# EasyEDA Pro project ref_dreamcast_v3.epro

# Schematic Schematic1
Board Name: Board1; Create Date: 2026-11-04; Page Name: P1; Project Name: RUSH - Dreamcast; Schematic Name: Schematic1; Update Date: 2026-11-15; Company: EasyEDA.com; Drawn: Erick; Page Size: A4; Version: V1.0
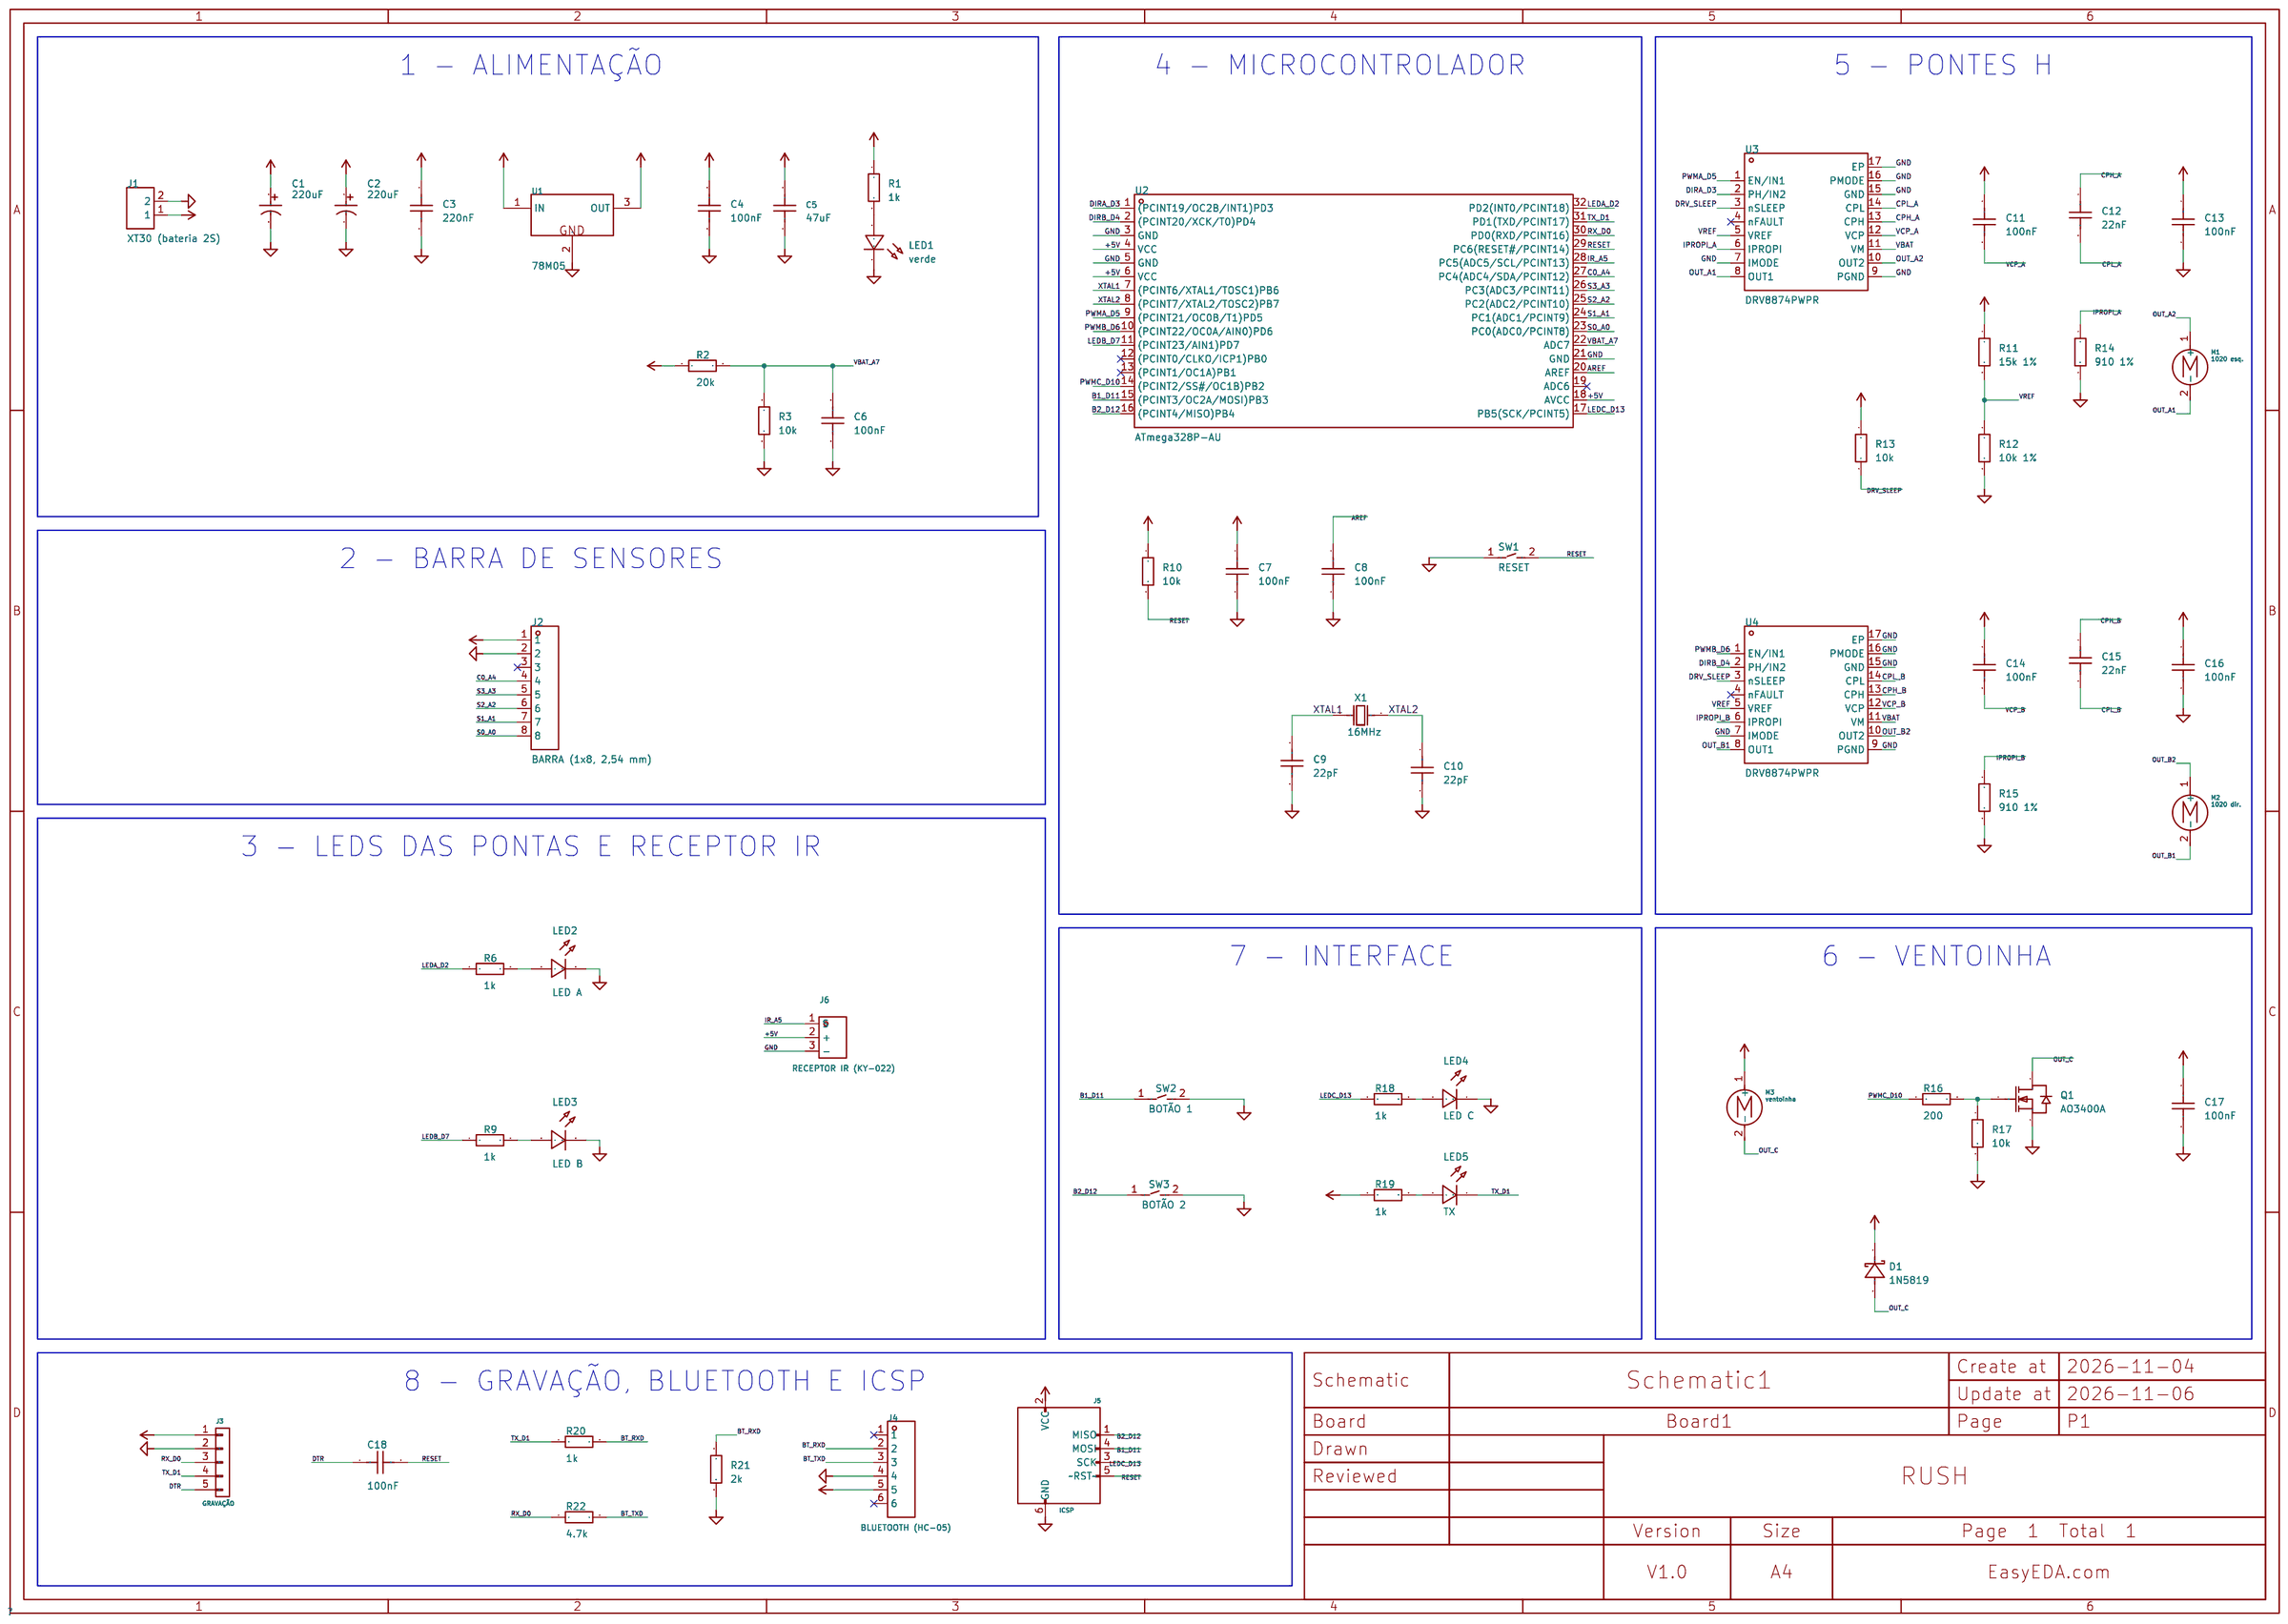
[diagram p0: schematic sheet]

## Parts
C1  220uF  [CAP-SMD_BD6.3-L6.6-W6.6-FD]
C2  220uF  [CAP-SMD_BD6.3-L6.6-W6.6-FD]
C3  220nF  [C0603]
C4  100nF  [C0603]
C5  47uF  [C1210]
C6  100nF  [C0603]
C7  100nF  [C0603]
C8  100nF  [C0603]
C9  22pF  [C0603]
C10  22pF  [C0603]
C11  100nF  [C0603]
C12  22nF  [C0603]
C13  100nF  [C0603]
C14  100nF  [C0603]
C15  22nF  [C0603]
C16  100nF  [C0603]
C17  100nF  [C0603]
C18  100nF  [C0603]
D1  1N5819  [SOD-123_L2.7-W1.6-LS3.7-RD-1]
J1  XT30 (bateria 2S)  [CONN-TH_XT30U-M]
J2  BARRA (1x8, 2,54 mm)  [HDR-TH_8P-P2.54-V-M]
J3  GRAVAÇÃO  [seguidor_alpha:HDR_1x05_P2.54_SMD_DEITADA]
J4  BLUETOOTH (femea 1x6, ordem HC-05)  [HDR-TH_6P-P2.54-V-F]
J5  ICSP  [seguidor_alpha:ICSP_6P_SMD_BOT]
J6  KY-022 (femea 1x3, S + -)  [HDR-TH_3P-P2.54-V-F_KY022]
LED1  verde  [LED0603-RD_GREEN]
LED2  LED A  [LED0603-RD_GREEN]
LED3  LED B  [LED0603-RD_GREEN]
LED4  LED C  [LED0603-RD_GREEN]
LED5  TX  [LED0603-RD_GREEN]
M1  1020 esq.  [seguidor_alpha:MOTOR_1020_2P]
M2  1020 dir.  [seguidor_alpha:MOTOR_1020_2P]
M3  ventoinha  [seguidor_alpha:MOTOR_1020_2P]
Q1  AO3400A  [SOT-23-3_L2.9-W1.3-P1.90-LS2.4-BR]
R1  1k  [R0603]
R2  20k 1%  [R0603]
R3  10k 1%  [R0603]
R6  1k  [R0603]
R9  1k  [R0603]
R10  10k  [R0603]
R11  15k 1%  [R0603]
R12  10k 1%  [R0603]
R13  10k  [R0603]
R14  910 1%  [R0603]
R15  910 1%  [R0603]
R16  200  [R0603]
R17  10k  [R0603]
R18  1k  [R0603]
R19  1k  [R0603]
R20  1k  [R0603]
R21  2k  [R0603]
R22  4.7k  [R0603]
SW1  RESET  [KEY-SMD_L6.1-W3.7-LS8.0-2]
SW2  BOTÃO 1  [KEY-SMD_L6.1-W3.7-LS8.0-2]
SW3  BOTÃO 2  [KEY-SMD_L6.1-W3.7-LS8.0-2]
U1  78M05  [TO-252-2_L6.5-W6.1-P4.58-LS10.0-TL]
U2  ATmega328P-AU  [TQFP-32_L7.0-W7.0-P0.80-LS9.0-BL]
U3  DRV8874PWPR  [HTSSOP-16_L5.0-W4.4-P0.65-LS6.4-BL-EP]
U4  DRV8874PWPR  [HTSSOP-16_L5.0-W4.4-P0.65-LS6.4-BL-EP]
X1  16MHz  [CRYSTAL-SMD_L5.0-W3.2]

## Library data of the parts
C1 C2 = CS1C221M-CRE77_C96175: Capacitance:220uF Tolerance:±20% Tolerance:±20% Voltage Rating:16V Ripple Current:- Equivalent Series Resistance(ESR):- Diameter:6.3mm Height - Seated (Max):7.7mm Lifetime:2000hrs@105℃ Operating Temperature:-40℃~+105℃ Operating Temperature:-40℃~+105℃ Pola; LCSC Part Name: 220uF ±20% 16V; Supplier Part: C96175; Manufacturer: ST(先科); Manufacturer Part: CS1C221M-CRE77; Supplier Footprint: SMD,D6.3xL7.7mm; JLCPCB Part Class: Extended Part; Datasheet: https://item.szlcsc.com/datasheet/CS1C221M-CRE77/97379.html; Supplier: LCSC; Tolerance: ±20%; Voltage Rating: 16V; Diameter: 6.3mm; Height - Seated (Max): 7.7mm; Lifetime: 2000hrs@105℃; Operating Temperature: -40℃~+105℃; Polarity type: Polarized
C3 = CAP_0603: Supplier Footprint: 0603; Encapsulamento: 0603 50 V; DNP: no; Voltage Rating: 50V
C4 C9 C10 = CAP_0603: Supplier Footprint: 0603; Encapsulamento: 0603; DNP: no; Voltage Rating: 16V
C5 = GRM32ER61A476KE20L: Capacitance:47uF Tolerance:±10% Tolerance:±10% Voltage Rating:10V Temperature Coefficient:X5R; LCSC Part Name: 47uF ±10% 10V; Supplier Part: C397312; Manufacturer: muRata(村田); Supplier Footprint: 1210; JLCPCB Part Class: Extended Part; Datasheet: https://item.szlcsc.com/datasheet/GRM32ER61A476KE20L/378872.html; Supplier: LCSC; Tolerance: ±10%; Voltage Rating: 10V; Temperature Coefficient: X5R
C6 = CAP_0603: filtro da medicao (opcional); Supplier Footprint: 0603; Encapsulamento: 0603; DNP: no; Voltage Rating: 16V
C7 = CAP_0603: junto aos pinos VCC; Supplier Footprint: 0603; Encapsulamento: 0603; DNP: no; Voltage Rating: 16V
C8 = CAP_0603: AREF (referencia = AVCC no firmware); Supplier Footprint: 0603; Encapsulamento: 0603; DNP: no; Voltage Rating: 16V
C11 C14 = CAP_0603: VCP -> VM; Supplier Footprint: 0603; Encapsulamento: 0603 16 V X7R; DNP: no; Voltage Rating: 16V
C12 C15 = CAP_0603: CPH -> CPL (tensao >= VM); Supplier Footprint: 0603; Encapsulamento: 0603 50 V X7R; DNP: no; Voltage Rating: 50V
C13 C16 = CAP_0603: VM, junto ao pino 11; Supplier Footprint: 0603; Encapsulamento: 0603 25 V X7R; DNP: no; Voltage Rating: 25V
C17 = CAP_0603: Supplier Footprint: 0603; Encapsulamento: 0603 25 V; DNP: no; Voltage Rating: 25V
C18 = CAP_0603: reset automatico pelo DTR; Supplier Footprint: 0603; Encapsulamento: 0603; DNP: no; Voltage Rating: 16V
D1 = 1N5819HW: diodo de roda livre (novo; o EVA-RT nao tem); LCSC Part Name: 电压:40V 电流:1A; Supplier Part: C2905649; Manufacturer: TECH PUBLIC(台舟); Supplier Footprint: SOD-123; JLCPCB Part Class: Extended Part; Datasheet: https://item.szlcsc.com/datasheet/1N5819HW/3175946.html; Supplier: LCSC; Voltage - Forward(Vf@If): 900mV@3A; Voltage - DC Reverse(Vr): 40V; Current - Rectified: 1A; Reverse Leakage Current (Ir): 1mA@40V; Non-Repetitive Peak Forward Surge Current: 9A; Encapsulamento: SOD-123 (B5819W) ou 1N5819 nos terminais do motor; DNP: no
J1 = XT30U-M.G.B: pino 1 = +, pino 2 = -; LCSC Part Name: AMASS(艾迈斯)模插头锂电池插头电机控制器充电器电池接头连接器焊接 2芯锂电插头 黑色 公头15AXT30U-M.G.B; Supplier Part: C19268020; Manufacturer: AMASS(艾迈斯); JLCPCB Part Class: Extended Part; Datasheet: https://item.szlcsc.com/datasheet/XT30U-M.G.B/20526031.html; Supplier: LCSC; Encapsulamento: XT30PW-M de placa ou rabicho XT30; DNP: no
J2 = 2.54-1*8: Pin Structure:1x8P Pitch:2.54mm Circluar Pins/Square Pins:Pin Header Mounting Type:Through Hole Number of Rows:1 Number of Pins:8P Current Rating:2.5A Length of Mating Pin:6mm Insulation Height:2.54mm Length of End Connection Pin:3mm Contact Material:Bras; LCSC Part Name: 1x8P 间距:2.54mm 方针 直插; Supplier Part: C5156616; Manufacturer: ZHOURI(洲日); Supplier Footprint: 插件,P=2.54mm; JLCPCB Part Class: Extended Part; Datasheet: https://item.szlcsc.com/datasheet/2.54-1*8/5790716.html; Supplier: LCSC; Pin Structure: 1x8P; Pitch: 2.54mm; Circluar Pins/Square Pins: Pin Header; Mounting Type: Through Hole; Number of Rows: 1; Number of Pins: 8P; Current Rating: 2.5A; Length of Mating Pin: 6mm; Insulation Height: 2.54mm; Length of End Connection Pin: 3mm; Contact Material: Brass; Contact Plating: Gold; Operating Temperature: -40℃~+105℃; Encapsulamento: barra de pinos 1x8 2,54 mm; DNP: no
J3 = Connector_Generic_Conn_01x05: 1=+5V, 2=GND, 3=RX_D0, 4=TX_D1, 5=DTR. Face inferior no layout.; Encapsulamento: 5 pads SMD, passo 2,54 mm; montagem na face inferior; DNP: no
J4 = 2.54-1*6P母: frente direita, x = 32,5; HC-06 nas vias 2-5 (virado); LCSC Part Name: 1x6P 间距:2.54mm 直插; Supplier Part: C40877; Manufacturer: BOOMELE(博穆精密); Supplier Footprint: 插件,P=2.54mm; JLCPCB Part Class: Extended Part; Datasheet: https://item.szlcsc.com/datasheet/2.54-1*6P%25E6%25AF%258D/41861.html; Supplier: LCSC; Holes Structure: 1x6P; Pitch: 2.54mm; Circular Hole / Square Hole: Square Hole; Mounting Type: Through Hole; Number of Rows: 1; Number of Positions: 6P; Current Rating: 3A; Holes Direction: Top; Insulation Height: 8.5mm; Contact Material: Brass; Contact Plating: Gold; Operating Temperature: -40℃~+105℃; PIN Length: 3.2mm; Encapsulamento: barra femea 1x6 2,54 mm; DNP: no
J5 = Connector_AVR-ISP-6: posicoes do EVA-RT: x 33,97/36,51; y -8,36/-10,90/-13,44; Encapsulamento: 6 pads SMD D1,8 em grade 2,54; DNP: no
J6 = Header-Female-2.54_1x3 (KY-022): barra femea 1x3; 1 = S (A5), 2 = +5V, 3 = GND; Holes Structure: 1x3P; Pitch: 2.54mm; Mounting Type: Through Hole; Number of Positions: 3P; Encapsulamento: barra femea 1x3 2,54 mm; DNP: no
LED1 = LED_0603-G: indica 5 V presente; Encapsulamento: 0603; DNP: no
LED2 LED3 LED5 = LED_0603-G: Encapsulamento: 0603; DNP: no
LED4 = LED_0603-G: vermelho; o LED3 em paralelo do EVA-RT foi retirado; Encapsulamento: 0603; DNP: no
M1 M2 = Motor_Motor_DC: coreless 1020 7,4 V; se girar ao contrario, inverta os fios; Encapsulamento: 2 pads; DNP: no
M3 = Motor_Motor_DC: coreless 1020 7,4 V; Encapsulamento: 2 pads; DNP: no
Q1 = AO3400A_C20917: no lugar do IRFR3411/RM10N100LD; liga totalmente com 5 V no gate; LCSC Part Name: N沟道 耐压:30V; Supplier Part: C20917; Manufacturer: AOS; Supplier Footprint: SOT-23; JLCPCB Part Class: Basic Part; Datasheet: https://item.szlcsc.com/datasheet/AO3400A/21629.html; Supplier: LCSC; Number: 1 N-channel; Drain to Source Voltage: 30V; Current - Continuous Drain(Id): 5.7A; RDS(on): 48mΩ@2.5V; Pd - Power Dissipation: 1.4W; Gate Threshold Voltage (Vgs(th)): 1.45V; Gate Charge(Qg): 7nC@10V; Input Capacitance(Ciss): 630pF; Reverse Transfer Capacitance (Crss@Vds): 50pF; Operating Temperature: -55℃~+150℃; Type: N-Channel; Output Capacitance(Coss): 75pF; Vgs: ±12V; Encapsulamento: SOT-23 (1 = G, 2 = S, 3 = D); DNP: no
R1 R6 R9 R18 R19 = Res_0603: Supplier Footprint: 0603; Encapsulamento: 0603; DNP: no
R2 R3 = Res_0603: medicao da bateria (opcional); Supplier Footprint: 0603; Encapsulamento: 0603; DNP: no
R10 = Res_0603: EVA-RT usava 1k; 10k com reset automatico por DTR; Supplier Footprint: 0603; Encapsulamento: 0603; DNP: no
R11 R12 = Res_0603: VREF = 2,0 V; Supplier Footprint: 0603; Encapsulamento: 0603; DNP: no
R13 = Res_0603: nSLEEP sempre alto (pull-down interno de 100k); Supplier Footprint: 0603; Encapsulamento: 0603; DNP: no
R14 R15 = Res_0603: IPROPI -> limite de corrente; Supplier Footprint: 0603; Encapsulamento: 0603; DNP: no
R16 = Res_0603: gate; Supplier Footprint: 0603; Encapsulamento: 0603; DNP: no
R17 = Res_0603: gate -> GND (desligado no boot); Supplier Footprint: 0603; Encapsulamento: 0603; DNP: no
R20 R21 = Res_0603: divisor 5 V -> 3,3 V; Supplier Footprint: 0603; Encapsulamento: 0603; DNP: no
R22 = Res_0603: 4,7k: grava com o HC-05 encaixado (sem LED de RX); Supplier Footprint: 0603; Encapsulamento: 0603; DNP: no
SW1-SW3 = TVBM17-025CF-R: Circuit:SPST Actuator Style:Rectangular Button Mounting Type:Surface Mount,Vertical Length:6.1mm Width:3.7mm Switch Height:2.5mm with Bracket:Without Bracket Contact Current:50mA Voltage Rating:12V With Lamp:No Termination Style:Gull Wing Operating Temper; LCSC Part Name: 一型/贴片/2.5H/250gf/黑底PPA白钮/防尘/编带; Supplier Part: C19271064; Manufacturer: jianfu(键富); Supplier Footprint: SMD,6.1x3.7mm; JLCPCB Part Class: Extended Part; Datasheet: https://item.szlcsc.com/datasheet/TVBM17-025CF-R/20539419.html; Supplier: LCSC; Circuit: SPST; Actuator Style: Rectangular Button; Mounting Type: Surface Mount,Vertical; Length: 6.1mm; Width: 3.7mm; Switch Height: 2.5mm; with Bracket: Without Bracket; Contact Current: 50mA; Voltage Rating: 12V; With Lamp: No; Termination Style: Gull Wing; Operating Temperature: -40℃~+85℃
U1 = 78M05_C111265: Output Configuration:Positive Voltage - Supply:35V Output Voltage:5V Output Voltage:5V Output Current:500mA Power Supply Rejection Ratio (PSRR):78dB@(120Hz) Voltage Dropout:2V@(500mA) standby current:6mA Noise:- Features:- Operating Temperature:-40℃~+125℃; LCSC Part Name: 5V 500mA 35V; Supplier Part: C111265; Manufacturer: SHIKUES(时科); Supplier Footprint: TO-252-2(DPAK); JLCPCB Part Class: Extended Part; Datasheet: https://item.szlcsc.com/datasheet/78M05/112491.html; Supplier: LCSC; Output Configuration: Positive; Voltage - Supply: 35V; Output Voltage: 5V; Output Current: 500mA; Power Supply Rejection Ratio (PSRR): 78dB@(120Hz); Voltage Dropout: 2V@(500mA); standby current: 6mA; Operating Temperature: -40℃~+125℃; Output Type: Fixed; Number of Outputs: 1; Encapsulamento: TO-252 (DPAK); DNP: no
U2 = ATMEGA328P-AU_C14877: do Nano/Uno doador (com bootloader) ou novo + bootloader pelo ICSP; LCSC Part Name: 基于AVR增强型RISC架构的低功耗CMOS 8位微控制器; Supplier Part: C14877; Manufacturer: MICROCHIP(美国微芯); Manufacturer Part: ATMEGA328P-AU; Supplier Footprint: TQFP-32(7x7); JLCPCB Part Class: Extended Part; Datasheet: https://item.szlcsc.com/datasheet/ATMEGA328P-AU/15549.html; Supplier: LCSC; CPU Core: AVR; CPU Maximum Speed: 20MHz; Core Size: 8 Bit; Program Storage Size: 32KB; Program Memory Type: FLASH; RAM Size: 2KB; EEPROM: 1KB; Number of I/O: 23; ADC (Bit): 10bit; Oscillator Type: Built-in; Voltage - Supply: 1.8V~5.5V; Operating Temperature: -40℃~+85℃; Features: External pin reset (NRST)；Built-in general-purpose timer；Power-on reset (POR)；Touch function；Undervoltage detection (BOR/LVD/LVR/LVI)；Programmable watchdog; Encapsulamento: TQFP-32; DNP: no
U3 = DRV8874PWPR: esq.; LCSC Part Name: 6A 有刷直流电机驱动芯片 4.5V~37V; Supplier Part: C1855818; Manufacturer: TI(德州仪器); Supplier Footprint: HTSSOP-16-EP; JLCPCB Part Class: Extended Part; Datasheet: https://www.ti.com/cn/lit/ds/symlink/drv8874.pdf; Supplier: LCSC; Technology: Yes; Number of H-bridges: 1; Peak Current: 6A; RDS(on): 200mΩ; Quiescent Current(Iq): 750nA; Operating Temperature: -40℃~+125℃; Features: Interleaved conduction protection；Current sensing/regulation function; Encapsulamento: HTSSOP-16 (PWP), pad termico com vias; DNP: no
U4 = DRV8874PWPR: dir.; LCSC Part Name: 6A 有刷直流电机驱动芯片 4.5V~37V; Supplier Part: C1855818; Manufacturer: TI(德州仪器); Supplier Footprint: HTSSOP-16-EP; JLCPCB Part Class: Extended Part; Datasheet: https://www.ti.com/cn/lit/ds/symlink/drv8874.pdf; Supplier: LCSC; Technology: Yes; Number of H-bridges: 1; Peak Current: 6A; RDS(on): 200mΩ; Quiescent Current(Iq): 750nA; Operating Temperature: -40℃~+125℃; Features: Interleaved conduction protection；Current sensing/regulation function; Encapsulamento: HTSSOP-16 (PWP), pad termico com vias; DNP: no
X1 = 7A-16.000MAAJ-T: Frequency:16MHz Normal temperature Frequency Tolerance:±30ppm Normal temperature Frequency Tolerance:±30ppm Load Capacitor: Frequency Stability(Full temperature range):±30ppm Frequency Stability(Full temperature range):±30ppm Equivalent Series Resistance; LCSC Part Name: 16MHz ±30ppm 18pF; Supplier Part: C2450102; Manufacturer: TXC(晶技); Supplier Footprint: SMD5032; JLCPCB Part Class: Extended Part; Datasheet: https://atta.szlcsc.com/upload/public/pdf/source/20180326/C97724_C4EFF7A16D0E132C961AD7AA14FCEEAA.pdf; Supplier: LCSC; Normal temperature Frequency Tolerance: ±30ppm; Frequency Stability(Full temperature range): ±30ppm; Equivalent Series Resistance (ESR): 50Ω

## Nets
+5V: C4.1 C5.2 C7.1 J2.1 J3.1(Pin) J4.5 J5.2(VCC) J6.2(+) R1.1 R10.1 R11.1 R13.1 R19.1 U1.3(OUT) U2.4(VCC) U2.6(VCC) U2.18(AVCC)
GND: C1.2 C2.2 C3.2 C4.2 C5.1 C6.2 C7.2 C8.2 C9.2 C10.2 C13.2 C16.2 C17.2 J1.2 J2.2 J3.2(Pin) J4.4 J5.6(GND) J6.3(-) LED1.1(C) LED2.1(C) LED3.1(C) LED4.1(C) Q1.2(S) R3.2 R12.2 R14.2 R15.2 R17.2 R21.2 SW1.1 SW2.2 SW3.2 U1.2(GND) U2.3(GND) U2.5(GND) U2.21(GND) U3.7(IMODE) U3.9(PGND) U3.15(GND) U3.16(PMODE) U3.17(EP) U4.7(IMODE) U4.9(PGND) U4.15(GND) U4.16(PMODE) U4.17(EP)
VBAT: C1.1 C2.1 C3.1 C11.1 C13.1 C14.1 C16.1 C17.1 D1.1(K) J1.1 M3.1(+) R2.1 U1.1(IN) U3.11(VM) U4.11(VM)
VBAT_A7: C6.1 R2.2 R3.1 U2.22(ADC7)
AREF: C8.1 U2.20(AREF)
B1_D11: J5.4(MOSI) SW2.1 U2.15((PCINT3/OC2A/MOSI)PB3)
B2_D12: J5.1(MISO) SW3.1 U2.16((PCINT4/MISO)PB4)
BT_RXD: J4.2 R20.2 R21.1
BT_TXD: J4.3 R22.2
C0_A4: J2.4 U2.27(PC4(ADC4/SDA/PCINT12))
CPH_A: C12.1 U3.13(CPH)
CPH_B: C15.1 U4.13(CPH)
CPL_A: C12.2 U3.14(CPL)
CPL_B: C15.2 U4.14(CPL)
DIRA_D3: U2.1((PCINT19/OC2B/INT1)PD3) U3.2(PH/IN2)
DIRB_D4: U2.2((PCINT20/XCK/T0)PD4) U4.2(PH/IN2)
DRV_SLEEP: R13.2 U3.3(nSLEEP) U4.3(nSLEEP)
DTR: C18.1 J3.5(Pin)
IPROPI_A: R14.1 U3.6(IPROPI)
IPROPI_B: R15.1 U4.6(IPROPI)
IR_A5: J6.1(S) U2.28(PC5(ADC5/SCL/PCINT13))
LEDA_D2: R6.1 U2.32(PD2(INT0/PCINT18))
LEDB_D7: R9.1 U2.11((PCINT23/AIN1)PD7)
LEDC_D13: J5.3(SCK) R18.1 U2.17(PB5(SCK/PCINT5))
OUT_A1: M1.2(-) U3.8(OUT1)
OUT_A2: M1.1(+) U3.10(OUT2)
OUT_B1: M2.2(-) U4.8(OUT1)
OUT_B2: M2.1(+) U4.10(OUT2)
OUT_C: D1.2(A) M3.2(-) Q1.3(D)
PWMA_D5: U2.9((PCINT21/OC0B/T1)PD5) U3.1(EN/IN1)
PWMB_D6: U2.10((PCINT22/OC0A/AIN0)PD6) U4.1(EN/IN1)
PWMC_D10: R16.1 U2.14((PCINT2/SS#/OC1B)PB2)
RESET: C18.2 J5.5(~RST~) R10.2 SW1.2 U2.29(PC6(RESET#/PCINT14))
RX_D0: J3.3(Pin) R22.1 U2.30(PD0(RXD/PCINT16))
S0_A0: J2.8 U2.23(PC0(ADC0/PCINT8))
S1_A1: J2.7 U2.24(PC1(ADC1/PCINT9))
S2_A2: J2.6 U2.25(PC2(ADC2/PCINT10))
S3_A3: J2.5 U2.26(PC3(ADC3/PCINT11))
TX_D1: J3.4(Pin) LED5.1(C) R20.1 U2.31(PD1(TXD/PCINT17))
VCP_A: C11.2 U3.12(VCP)
VCP_B: C14.2 U4.12(VCP)
VREF: R11.2 R12.1 U3.5(VREF) U4.5(VREF)
XTAL1: C9.1 U2.7((PCINT6/XTAL1/TOSC1)PB6) X1.1(OSC1)
XTAL2: C10.1 U2.8((PCINT7/XTAL2/TOSC2)PB7) X1.2(OSC2)
$1N2286: LED1.2(A) R1.2
$1N2289: LED2.2(A) R6.2
$1N2298: LED3.2(A) R9.2
$1N2345: LED4.2(A) R18.2
$1N2346: LED5.2(A) R19.2
$1N2435: Q1.1(G) R16.2 R17.1

Not connected (* = marked no-connect by the designer): J2 3*; J4 1* 6*; U2 12((PCINT0/CLKO/ICP1)PB0)* 13((PCINT1/OC1A)PB1)* 19(ADC6)*; U3 4(nFAULT)*; U4 4(nFAULT)*

## Notes on the sheet
- 1 - ALIMENTAÇÃO
- 4 - MICROCONTROLADOR
- 5 - PONTES H
- 2 - BARRA DE SENSORES
- 3 - LEDS DAS PONTAS E RECEPTOR IR
- 7 - INTERFACE
- 6 - VENTOINHA
- 8 - GRAVAÇÃO, BLUETOOTH E ICSP

# Board PCB1
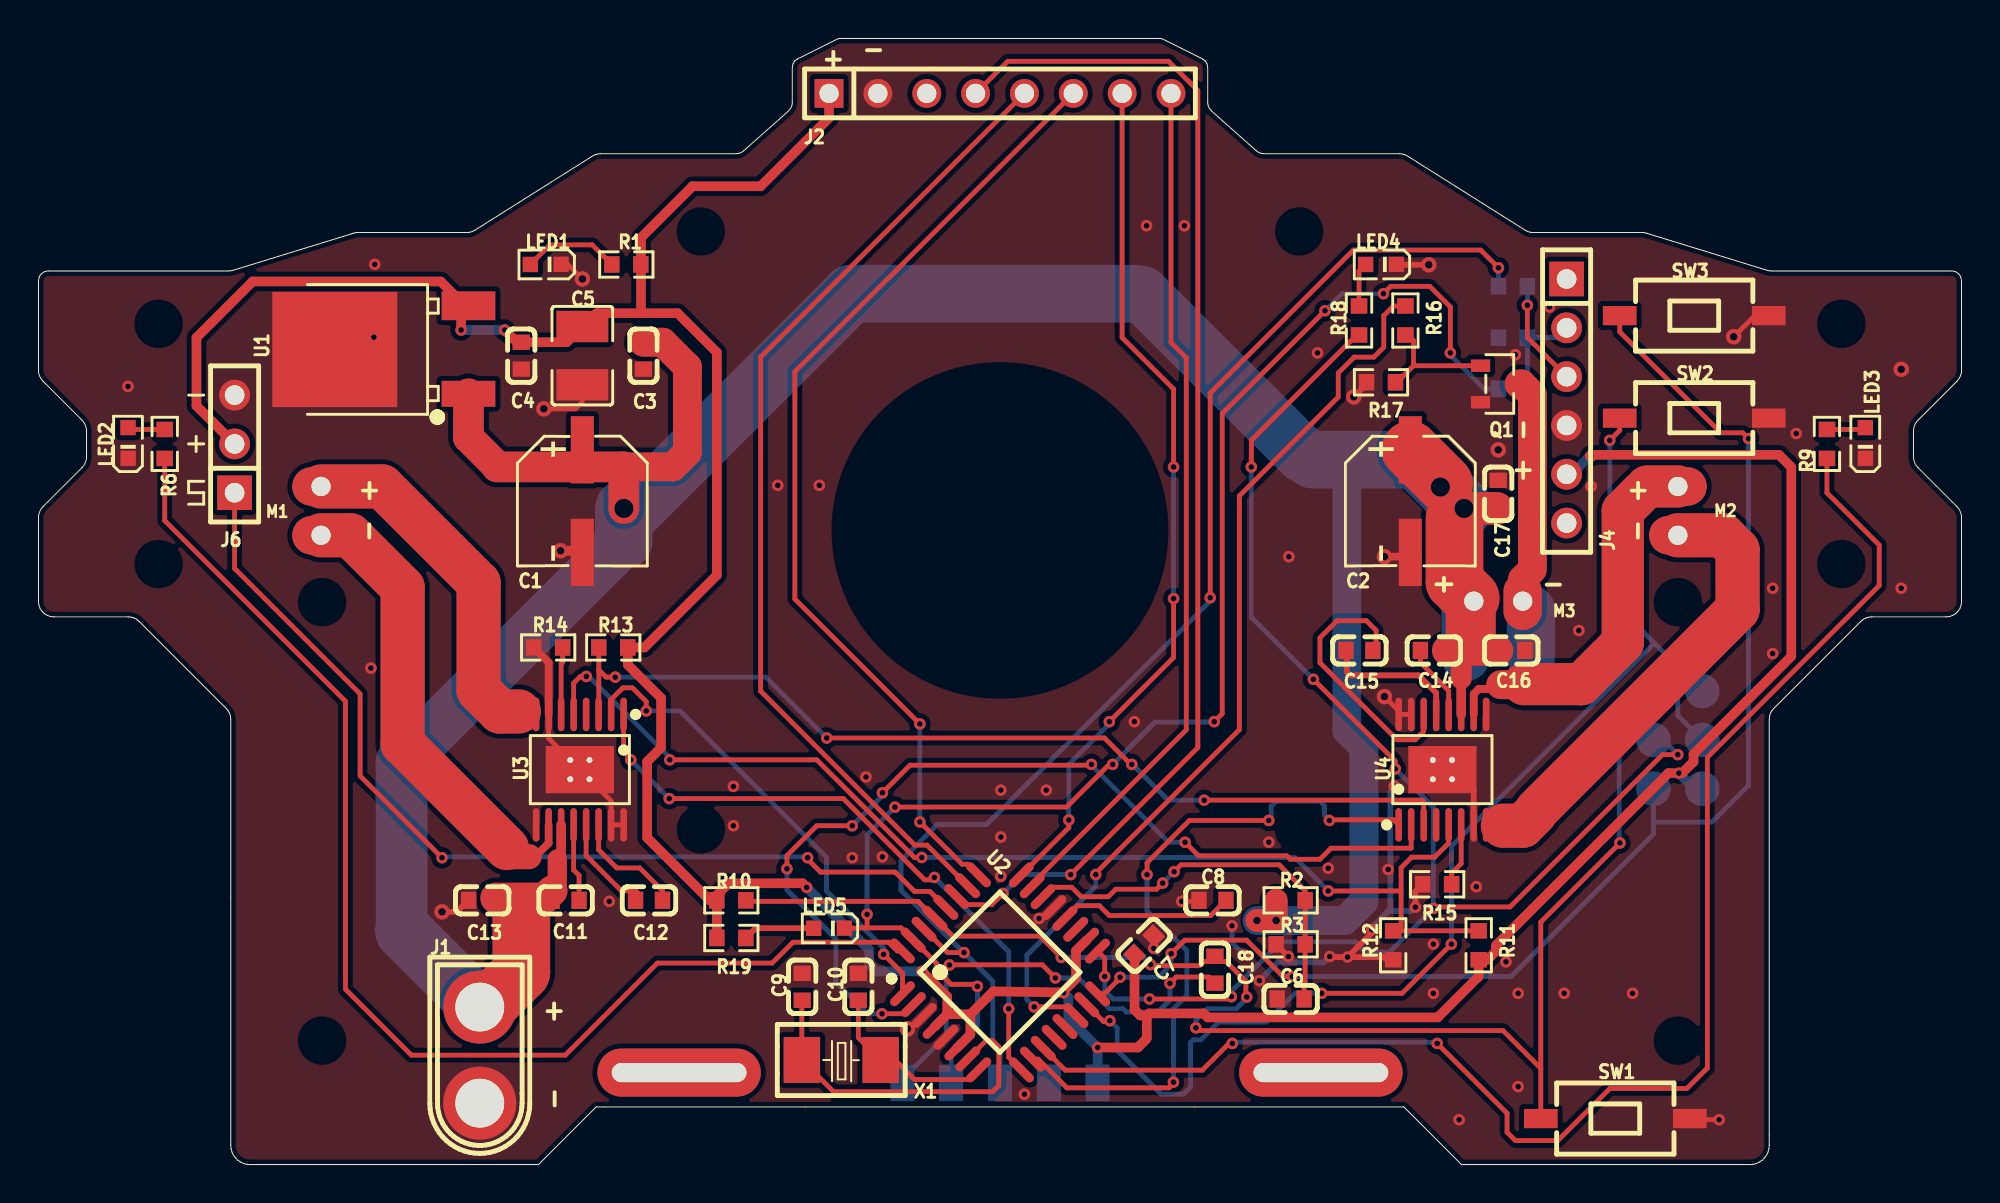
[diagram p1: board, top side]
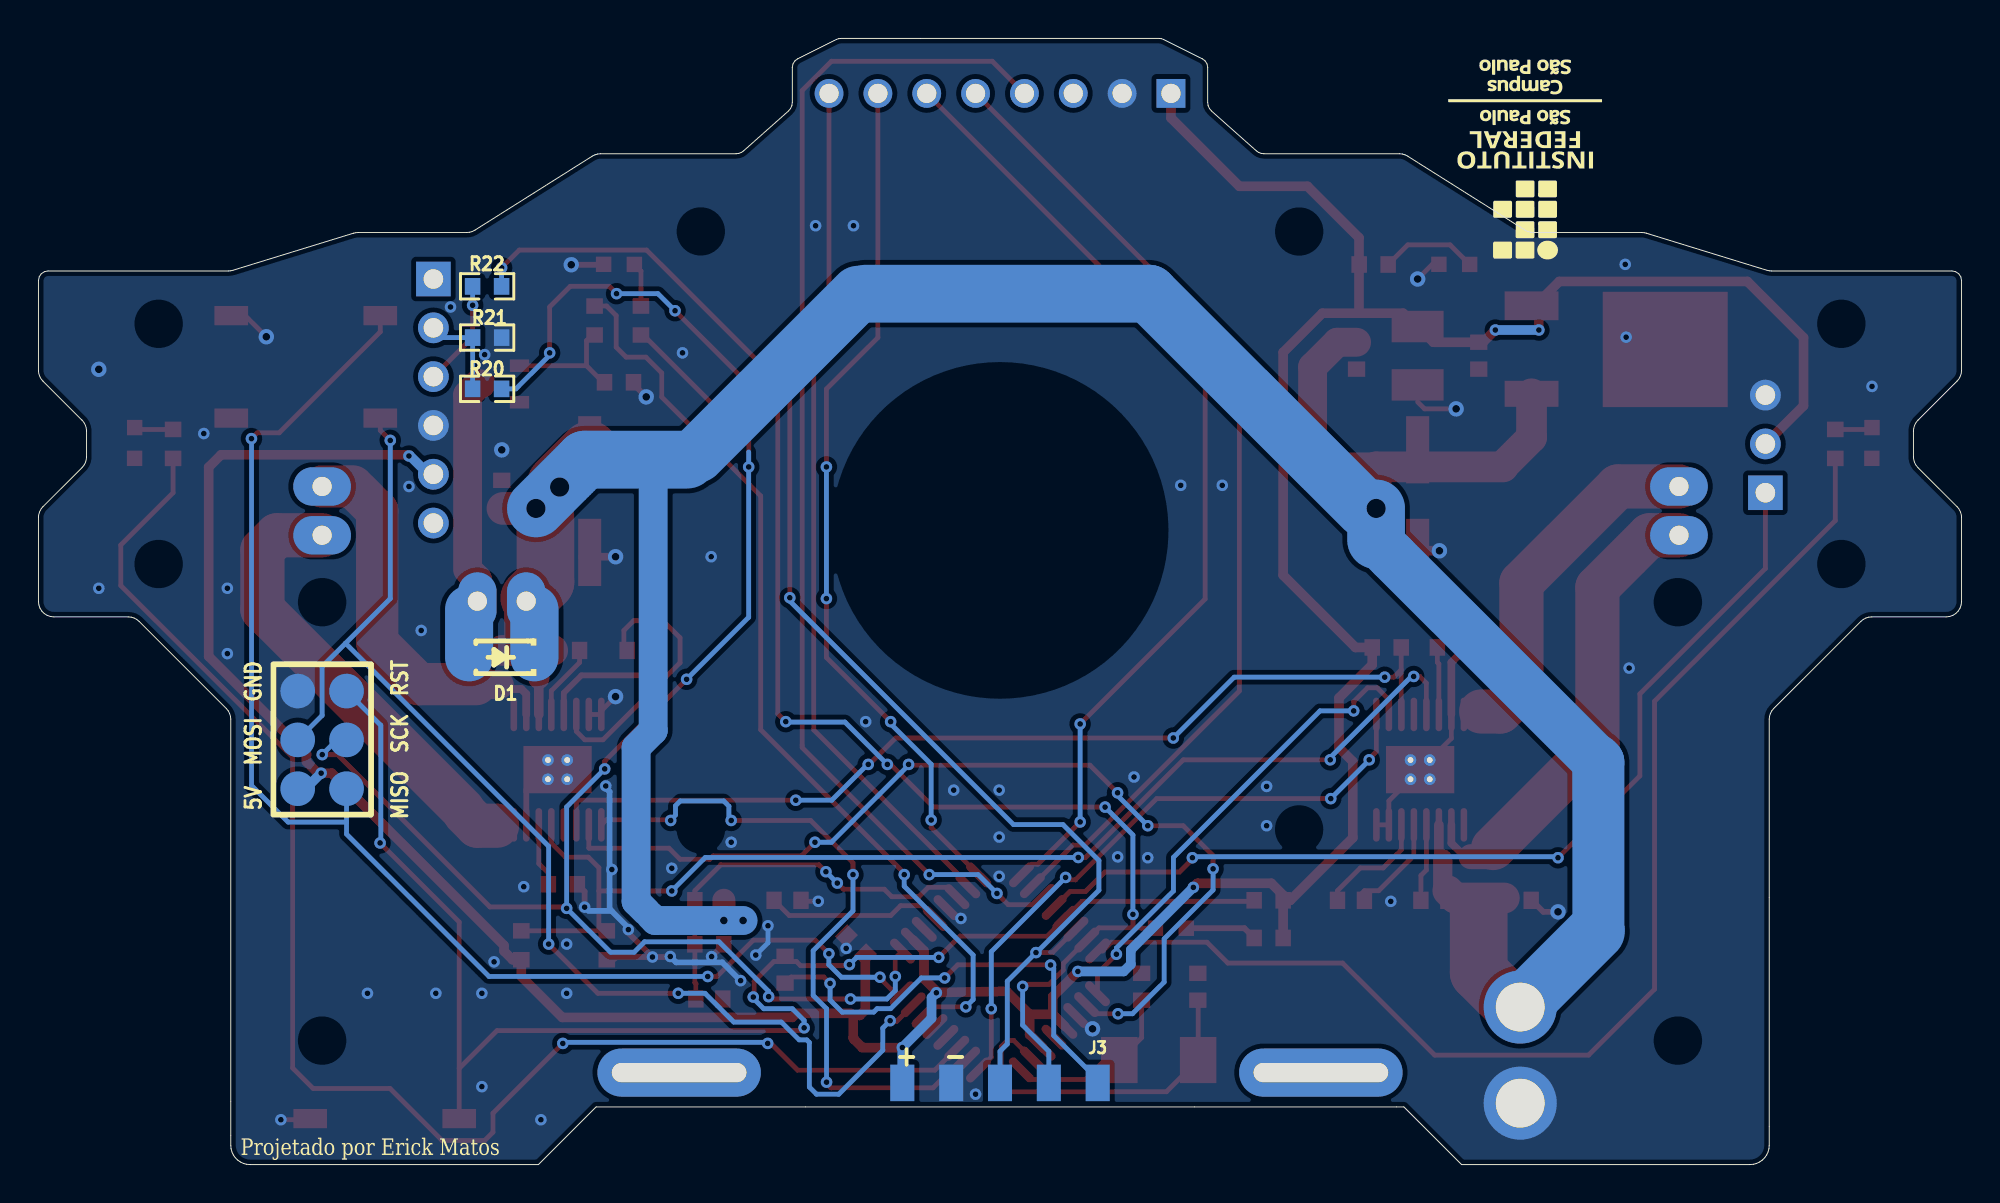
[diagram p2: board, bottom side, seen from below]

Outline 100 x 58.6 mm; copper layers: Top Layer, Bottom Layer. Coordinates in mm from the lower left corner of the outline.
Outline path: 0,46 0,41.33 arc(0.06,41.03) 0.23,40.77 2.27,38.73 arc(2.44,38.47) 2.5,38.17 2.5,36.83 arc(2.44,36.53) 2.27,36.27 0.23,34.23 arc(0.06,33.97) 0,33.67 0,29.3 0.02,29.12 0.08,28.95 0.17,28.8 0.3,28.67 0.45,28.58 0.62,28.52 0.8,28.5 4.67,28.5 4.83,28.48 4.97,28.44 5.11,28.36 5.23,28.27 9.77,23.73 9.86,23.61 9.94,23.47 9.98,23.33 10,23.17 10,1 10.02,0.83 10.06,0.66 10.13,0.5 10.23,0.36 10.36,0.23 10.5,0.13 10.66,0.06 10.83,0.01 11,0 26,0 29,3 71,3 74,0 89,0 89.17,0.01 89.34,0.06 89.5,0.13 89.64,0.23 89.77,0.36 89.87,0.5 89.94,0.66 89.99,0.83 90,1 90,23.17 90.01,23.33 90.06,23.47 90.13,23.61 90.23,23.73 94.77,28.27 94.89,28.36 95.03,28.44 95.18,28.48 95.33,28.5 99.2,28.5 99.38,28.52 99.55,28.58 99.7,28.67 99.82,28.8 99.92,28.95 99.98,29.12 100,29.3 100,33.67 arc(99.94,33.97) 99.77,34.23 97.73,36.27 arc(97.56,36.53) 97.5,36.83 97.5,38.17 arc(97.56,38.47) 97.73,38.73 99.77,40.77 arc(99.94,41.03) 100,41.33 100,46 99.96,46.19 99.85,46.35 99.69,46.46 99.5,46.5 90.12,46.5 90,46.51 89.88,46.53 83.62,48.47 83.5,48.49 83.38,48.5 77.73,48.5 77.58,48.51 77.44,48.56 77.3,48.62 71.2,52.48 71.06,52.54 70.92,52.59 70.77,52.6 63.73,52.6 63.58,52.62 63.45,52.67 63.33,52.75 61,54.82 60.89,54.95 60.82,55.1 60.8,55.27 60.8,57.09 60.77,57.27 60.67,57.43 60.52,57.54 58.51,58.55 58.4,58.59 58.28,58.6 41.72,58.6 41.6,58.59 41.49,58.55 39.48,57.54 39.33,57.43 39.23,57.27 39.2,57.09 39.2,55.27 39.18,55.1 39.11,54.95 39,54.82 36.67,52.75 36.55,52.67 36.42,52.62 36.27,52.6 29.23,52.6 29.08,52.59 28.94,52.54 28.8,52.48 22.7,48.62 22.56,48.56 22.42,48.51 22.27,48.5 16.62,48.5 16.5,48.49 16.39,48.47 10.11,46.53 10,46.51 9.88,46.5 0.5,46.5 0.31,46.46 0.15,46.35 0.04,46.19 0,46
Stack: Top Layer 0.035mm / Dielectric1 1.51mm FR4 er 4.5 / Bottom Layer 0.035mm

## Design rules (mm)
spacing copperThickness1oz (default): track to track 0.2, other pairs 0.2 to 0.3
spacing copperThickness2oz: track to track 0.203, other pairs 0.152 to 0.3
spacing Plane_innerPlane: track to track 0.2, other pairs 0.2 to 0.3
spacing Copper_copperRegion: track to track 0.2, other pairs 0.2 to 0.3
track width copperThickness1oz (default): min 0.25, default 0.25, max 3
track width copperThickness2oz: min 0.203, default 0.254, max 2.54
differential pair differentialPair (default): width min 0.127, default 0.254, max 2.54; gap min 0.152, default 0.152
net GND uses Copper_copperRegion, Plane_innerPlane
pour e1249 uses Copper_copperRegion
pour e1258 uses Copper_copperRegion

## Placement (name value [footprint] x y rotation side)
C1  220uF  [CAP-SMD_BD6.3-L6.6-W6.6-FD]  28.28 34.52 270 top
C2  220uF  [CAP-SMD_BD6.3-L6.6-W6.6-FD]  71.34 34.52 270 top
C3  220nF  [C0603]  31.46 42.09 270 top
C4  100nF  [C0603]  25.11 42.09 270 top
C5  47uF  [C1210]  28.28 42.09 90 top
C6  100nF  [C0603]  65.11 8.62 180 top
C7  100nF  [C0603]  57.49 11.41 45 top
C8  100nF  [C0603]  61.05 13.75 180 top
C9  22pF  [C0603]  39.71 9.25 90 top
C10  22pF  [C0603]  42.63 9.25 90 top
C11  100nF  [C0603]  27.41 13.75 0 top
C12  22nF  [C0603]  31.75 13.75 0 top
C13  100nF  [C0603]  23.08 13.75 180 top
C14  100nF  [C0603]  72.56 26.75 180 top
C15  22nF  [C0603]  68.69 26.75 0 top
C16  100nF  [C0603]  76.59 26.75 0 top
C17  100nF  [C0603]  75.91 34.91 90 top
C18  100nF  [C0603]  61.18 10.14 90 top
D1  1N5819  [SOD-123_L2.7-W1.6-LS3.7-RD-1]  75.91 26.4 0 bottom
J1  XT30 (bateria 2S)  [CONN-TH_XT30U-M]  22.95 5.69 270 top
J2  BARRA (1x8, 2,54 mm)  [HDR-TH_8P-P2.54-V-M]  50 55.74 0 top
J3  GRAVAÇÃO  [seguidor_alpha:HDR_1x05_P2.54_SMD_DEITADA]  50 4.25 0 bottom
J4  BLUETOOTH (femea 1x6, ordem HC-05)  [HDR-TH_6P-P2.54-V-F]  79.46 39.73 270 top
J5  ICSP  [seguidor_alpha:ICSP_6P_SMD_BOT]  85.25 22.1 0 bottom
J6  KY-022 (femea 1x3, S + -)  [HDR-TH_3P-P2.54-V-F_KY022]  10.2 37.5 90 top
LED1  verde  [LED0603-RD_GREEN]  26.38 46.84 180 top
LED2  LED A  [LED0603-RD_GREEN]  4.66 37.55 90 top
LED3  LED B  [LED0603-RD_GREEN]  95 37.55 90 top
LED4  LED C  [LED0603-RD_GREEN]  69.81 46.84 180 top
LED5  TX  [LED0603-RD_GREEN]  41.11 12.3 180 top
M1  1020 esq.  [seguidor_alpha:MOTOR_1020_2P]  14.69 34.02 0 top
M2  1020 dir.  [seguidor_alpha:MOTOR_1020_2P]  85.25 34.02 180 top
M3  ventoinha  [seguidor_alpha:MOTOR_1020_2P]  75.91 29.32 270 top
NOREF  -  [Pad_e259]  66.69 4.79 270 top
NOREF#2  -  [Pad_e260]  33.31 4.79 270 top
Q1  AO3400A  [SOT-23-3_L2.9-W1.3-P1.90-LS2.4-BR]  75.99 40.62 180 top
R1  1k  [R0603]  30.57 46.84 180 top
R2  20k 1%  [R0603]  65.11 13.75 0 top
R3  10k 1%  [R0603]  65.11 11.46 180 top
R6  1k  [R0603]  6.57 37.5 90 top
R9  1k  [R0603]  93 37.5 90 top
R10  10k  [R0603]  36.03 13.75 0 top
R11  15k 1%  [R0603]  74.89 11.41 90 top
R12  10k 1%  [R0603]  70.45 11.41 270 top
R13  10k  [R0603]  29.89 26.91 180 top
R14  910 1%  [R0603]  26.5 26.91 180 top
R15  910 1%  [R0603]  72.73 14.58 180 top
R16  200  [R0603]  71.08 43.92 270 top
R17  10k  [R0603]  69.81 40.71 180 top
R18  1k  [R0603]  68.67 43.92 90 top
R19  1k  [R0603]  36.03 11.79 0 top
R20  1k  [R0603]  76.67 40.37 0 bottom
R21  2k  [R0603]  76.67 43.03 180 bottom
R22  4.7k  [R0603]  76.67 45.7 0 bottom
SW1  RESET  [KEY-SMD_L6.1-W3.7-LS8.0-2]  82 2.39 180 top
SW2  BOTÃO 1  [KEY-SMD_L6.1-W3.7-LS8.0-2]  86.1 38.84 0 top
SW3  BOTÃO 2  [KEY-SMD_L6.1-W3.7-LS8.0-2]  86.1 44.18 0 top
U1  78M05  [TO-252-2_L6.5-W6.1-P4.58-LS10.0-TL]  18.89 42.4 180 top
U2  ATmega328P-AU  [TQFP-32_L7.0-W7.0-P0.80-LS9.0-BL]  50 10 315 top
U3  DRV8874PWPR  [HTSSOP-16_L5.0-W4.4-P0.65-LS6.4-BL-EP]  28.15 20.55 180 top
U4  DRV8874PWPR  [HTSSOP-16_L5.0-W4.4-P0.65-LS6.4-BL-EP]  73.01 20.55 0 top
X1  16MHz  [CRYSTAL-SMD_L5.0-W3.2]  41.75 5.44 0 top

## Footprints (pads in the part's own frame, mm; a bottom-side part is the same pattern mirrored in y, then rotated)
C0603
  rect 0.8x0.9 smd: 1(-0.7,0) 2(0.7,0)
C1210
  rect 1.635x2.7 smd: 1(-1.518,0) 2(1.518,0)
CAP-SMD_BD6.3-L6.6-W6.6-FD
  rect 3.5x1.2 smd: 1(-2.67,0) 2(2.67,0)
CONN-TH_XT30U-M
  round 3.8 hole 2.54: 1(-2.5,0) 2(2.5,0)
CRYSTAL-SMD_L5.0-W3.2
  rect 1.9x2.4 smd: 1(-2.05,0) 2(2.05,0)
HDR-TH_3P-P2.54-V-F_KY022
  rect 1.8x1.8 hole 1.02: 1(-2.54,0)
  round 1.6 hole 1.02: 2(0,0) 3(2.54,0)
HDR-TH_6P-P2.54-V-F
  rect 1.8x1.8 hole 1.02: 1(-6.35,0)
  round 1.6 hole 1.02: 2(-3.81,0) 3(-1.27,0) 4(1.27,0) 5(3.81,0) 6(6.35,0)
HDR-TH_8P-P2.54-V-M
  rect 1.5x1.5 hole 1: 1(-8.89,0)
  round 1.5 hole 1: 2(-6.35,0) 3(-3.81,0) 4(-1.27,0) 5(1.27,0) 6(3.81,0) 7(6.35,0) 8(8.89,0)
HTSSOP-16_L5.0-W4.4-P0.65-LS6.4-BL-EP
  oval 0.343x1.746 smd: 1(-2.275,-2.873) 2(-1.625,-2.873) 3(-0.975,-2.873) 4(-0.325,-2.873) 5(0.325,-2.873) 6(0.975,-2.873) 7(1.625,-2.873) 8(2.275,-2.873) 9(2.275,2.873) 10(1.625,2.873) 11(0.975,2.873) 12(0.325,2.873) 13(-0.325,2.873) 14(-0.975,2.873) 15(-1.625,2.873) 16(-2.275,2.873)
  round 0.61 hole 0.305: 17(-0.5,0.5) 17(-0.5,-0.5) 17(0.5,0.5) 17(0.5,-0.5)
  rect 3.55x2.46 smd: 17(0,0)
KEY-SMD_L6.1-W3.7-LS8.0-2
  rect 1.75x1 smd: 1(-3.875,0) 2(3.875,0)
LED0603-RD_GREEN
  rect 0.8x0.8 smd: 1(-0.799,-0.004) 2(0.799,0.004)
Pad_e259
  oval 2.5x8.5 hole 1x7: 1(0,0)
Pad_e260
  oval 2.5x8.5 hole 1x7: 1(0,0)
R0603
  rect 0.806x0.864 smd: 1(-0.753,0) 2(0.753,0)
seguidor_alpha:HDR_1x05_P2.54_SMD_DEITADA
  rect 1.25x1.9 smd: 1(5.08,0) 2(2.54,0) 3(0,0) 4(-2.54,0) 5(-5.08,0)
seguidor_alpha:ICSP_6P_SMD_BOT
  round 1.8 smd: 1(-1.27,2.54) 2(1.27,2.54) 3(-1.27,0) 4(1.27,0) 5(-1.27,-2.54) 6(1.27,-2.54)
seguidor_alpha:MOTOR_1020_2P
  oval 3x2 hole 1: 1(0,-1.27) 2(0,1.27)
SOD-123_L2.7-W1.6-LS3.7-RD-1
  rect 1.2x0.95 smd: 1(-1.7,0) 2(1.7,0)
SOT-23-3_L2.9-W1.3-P1.90-LS2.4-BR
  rect 1x0.65 smd: 1(1,-0.95) 2(1,0.95) 3(-1,0)
TO-252-2_L6.5-W6.1-P4.58-LS10.0-TL
  rect 2.8x1.35 smd: 1(-3.475,2.29)
  rect 6.5x6 smd: 2(3.475,-0.017)
  rect 2.8x1.5 smd: 3(-3.475,-2.29)
TQFP-32_L7.0-W7.0-P0.80-LS9.0-BL
  oval 0.45x1.65 smd: 1(-2.8,-4.369) 2(-2,-4.369) 3(-1.2,-4.369) 4(-0.4,-4.369) 5(0.4,-4.369) 6(1.2,-4.369) 7(2,-4.369) 8(2.8,-4.369) 17(2.8,4.369) 18(2,4.369) 19(1.2,4.369) 20(0.4,4.369) 21(-0.4,4.369) 22(-1.2,4.369) 23(-2,4.369) 24(-2.8,4.369)
  oval 1.65x0.45 smd: 9(4.381,-2.8) 10(4.381,-2) 11(4.381,-1.2) 12(4.381,-0.4) 13(4.381,0.4) 14(4.381,1.2) 15(4.381,2) 16(4.381,2.8) 25(-4.381,2.8) 26(-4.381,2) 27(-4.381,1.2) 28(-4.381,0.4) 29(-4.381,-0.4) 30(-4.381,-1.2) 31(-4.381,-2) 32(-4.381,-2.8)

## Nets
As in the schematic.

Pads without a net: J2 3; J4 1 6; NOREF 1; NOREF#2 1; U3 4; U4 4

## Via types
v1: diameter 0.8, hole 0.4, Top Layer to Bottom Layer, 14 vias
v2: diameter 1.6, hole 1, Top Layer to Bottom Layer, 3 vias
v3: diameter 0.6, hole 0.3, Top Layer to Bottom Layer, 139 vias

## Routing (per net, layer and track width the routed paths; a pad name or vN(x,y) marks a point on that pad's centre or on a via; arc(x,y) is an arc through that point)
+5V: length 199
  Top Layer w0.5: v3(21.98,43.43) 21.98,44.89 20.92,45.95 11.14,45.95 8.22,43.03 8.22,39.48 J6.2 ; 47.25,7.82 48.46,7.82 ; 47.25,7.82 U2.4 ; 47.25,7.82 47.25,8.74 45.95,10.04 v3(45.95,10.05) ; 48.46,7.82 48.46,6.76 U2.6 ; 48.46,7.82 49.65,9.01 53.03,8.96 53.24,8.95 53.95,9.67 53.95,11.12 U2.18 ; 31.33,44.56 31.33,48.23 34.01,50.91 37.55,50.91 41.11,54.46 J2.1 ; R10.1 35.28,14.02 35.89,14.64 39.73,14.64 v3(39.95,14.42) ; R10.1 R19.1 ; R10.1 34.91,13.75 31.65,17 31.65,20.97 32.37,21.69 32.37,24.28 30.64,26.01 R13.1 31.51,26.91 35.28,30.67 35.28,42.26 33.24,44.3 29.04,44.3 28.28,43.61 ; 57.63,7.76 57.66,7.76 57.76,7.86 60.59,7.86 60.8,7.66 72.76,7.66 74.89,9.79 R11.1 75.34,10.66 75.79,11.11 75.79,11.4 84.75,20.37 v3(85.3,20.37) 85.47,20.37 86.06,20.96 86.06,21.36 91.15,26.45 91.15,36.29 90.5,36.93 80.73,36.93 80.67,36.87 ; 57.63,7.76 57.29,7.76 57,8.05 C7.1 ; 57.63,7.76 57.63,6.6 57.61,6.57 57.61,6.53 57.17,6.09 v3(55.08,6.09) ; v3(24.24,43.43) 24.97,42.7 ; C4.1 27.47,42.79 C5.2
  Bottom Layer w0.5: 80.67,36.87 79.72,35.92 J4.5 ; v3(85.3,20.37) 86.11,19.56 J5.2 ; 55.08,4.43 v3(55.08,6.09) 53.56,7.61 53.56,8.69 v3(53.31,8.94) ; v3(45.95,10.05) 43.57,10.05 43.2,10.42 43.2,11.17 v3(39.95,14.42) ; v3(21.98,43.43) v3(24.24,43.43)
  vias: v3(80.73,36.87)
GND: length 51.8
  Top Layer w0.25: 28.28,39.68 27.92,39.32 v1(26.28,39.32) ; v1(88.15,43.08) 89.25,44.18 SW3.2 ; 71.38,23.42 U4.16 70.73,23.61 v1(69.99,24.35) ; SW1.1 85.93,2.33 v3(87.4,2.33) ; U3.7 26.53,22.17 U3.17 U3.17 U3.17 29.78,18.92 U3.15 U3.16 ; v1(28.28,46.08) 27.52,46.85 LED1.1 ; v3(59.45,13.7) 60.3,13.7 60.35,13.75
  Top Layer w0.3: v3(68.07,10.8) 69.95,10.8 70.05,10.7 ; v3(68.07,10.8) 67.17,10.8 v3(67.15,10.83) ; v3(68.07,10.8) 69.33,12.05 v3(69.33,12.23) ; v3(71.6,13.4) 71.6,14.21 R15.2 ; 22.45,13.85 21.75,13.15 21.05,13.15 ; LED4.1 70.63,46.82 v1(72.3,46.82) ; 74.63,18.45 74.63,19.52 ; R3.2 v3(65,10.82) ; R17.2 69.06,40.61 v1(68.4,39.95)
  Top Layer w0.4: R14.2 26.53,26.13 U3.7 ; 71.72,31.63 70.03,31.63
  Top Layer w0.5: v1(27.15,31.94) 27.98,31.94
  Bottom Layer w0.25: v3(62.06,12.43) 62.06,11.54 v3(62.7,10.9)
  Bottom Layer w0.3: 70.2,13.2 69.33,12.33 v3(69.33,12.23) ; 70.2,13.2 70.3,13.3 70.3,19.4 70.4,19.5 ; 70.2,13.2 71.4,13.2 ; v3(67.15,10.83) 66.84,10.52 64.44,10.52 v3(63.49,9.57)
  vias: v1(20.98,13.15) v1(45.19,7.06) v1(69.99,31.63) v1(75.91,37.19) v1(96.86,41.38) v3(4.66,40.49) v3(17.29,25.83) v3(17.44,43.05) v3(17.49,46.84) v3(29.68,13.7) v3(36.14,19.68) v3(36.14,17.63) v3(38.44,35.35) v3(40.6,35.35) v3(42.32,15.97) v3(43.03,20.17) v3(43.88,16.01) v3(50.04,19.48) v3(50.04,17.04) v3(50.04,15) v3(51.27,3.66) v3(52.03,12.81) v3(52.41,19.48) v3(56.99,23.05) v3(57.62,48.85) v3(58,11.25) v3(59.59,48.85) v3(63.98,16.77) v3(65.02,31.63) v3(66.51,42.24) v3(67.07,15.42) v3(70.18,15.35) v3(70.5,19.7) v3(72.53,11.47) v3(72.53,8.91) v3(73.87,2.33) v3(74.76,14.46) v3(76.31,10.55) v3(76.8,42.14) v3(76.94,8.91) v3(76.94,4.06) v3(78.57,44.62) v3(79.34,8.91) v3(80.1,27.79) v3(80.73,35.29) v3(82.89,8.91) v3(90.18,29.99) v3(90.18,26.59) v3(91.4,38.04) v3(96.86,29.99)
VBAT: length 171.4
  Top Layer w0.25: 23.83,36.36 23.83,36.31
  Top Layer w0.4: 73.98,25.3 73.9,25.3
  Top Layer w0.5: 26.98,15.9 27.18,16.1 U3.11 ; U4.11 73.98,25.3
  Top Layer w1: 26.98,15.9 26.98,14.52
  Top Layer w1.1: 73.98,25.3 73.98,26.75
  Top Layer w1.2: v1(63.36,12.7) v1(64.36,12.7) R2.1
  Top Layer w1.5: C3.1 32.46,42.79 33.74,41.51 33.74,37.07 32.98,36.31 30.44,36.31
  Top Layer w1.6: 23.83,36.31 30.44,36.31 30.44,34.14 ; 23.83,36.36 22.36,37.83 U1.1 ; C14.1 C16.1 ; 26.71,14.25 26.33,13.87 23.78,13.87
  Top Layer w1.7: v2(74.13,34.14) 75.85,34.14
  Top Layer w2.6: 74.48,29.3 74.48,27.28
  Top Layer w3: 74.48,29.48 73.64,30.32 73.64,33.65 ; 25.11,13.06 25.11,10.01 23.29,8.19 J1.1 ; 73.09,35.44 C2.1
  Bottom Layer w1.5: 68.41,13.19 68.92,13.7 68.92,21.7 68.03,22.59 68.03,36.43 ; v1(63.36,12.7) v1(64.36,12.7) 67.93,12.7 68.16,12.93
  Bottom Layer w2: M3.1 74.21,28.89
  Bottom Layer w2.5: 31.08,34.14 v2(30.44,34.14) ; 74.21,28.89 D1.1
  Bottom Layer w2.6: 30.44,32.49 19.01,21.06
  Bottom Layer w2.7: 19.01,21.06 18.89,20.94 18.89,12.26 19.01,12.13
  Bottom Layer w2.9: 57.37,45.32 65.75,36.94
  Bottom Layer w3: 66.26,36.68 71.59,36.68 v2(74.13,34.14) ; v2(30.44,34.14) 30.44,32.49 ; 56.99,45.32 42.25,45.32 31.08,34.14 ; 19.01,12.13 J1.1
  vias: v2(72.9,35.25)
VBAT_A7: length 20.9
  Top Layer w0.25: v3(58.46,14.65) 58.14,14.33 56.02,14.33 55.63,13.94 54.22,13.94 53.73,14.43 52.73,14.43 U2.22 ; C6.1 65.81,9.41 65.87,9.46 R3.1 65.87,14.25 64.52,15.6 59.41,15.6 v3(59.05,15.24)
  Bottom Layer w0.25: v3(59.05,15.24) v3(58.46,14.65)
AREF: length 9.2
  Top Layer w0.25: U2.20 54.04,13.47 55.17,13.47 55.68,12.96 60.96,12.96 C8.1
B1_D11: length 65.2
  Top Layer w0.25: U2.15 55.38,7.45 55.68,7.45 v3(55.71,7.49) ; v3(66.73,8.91) 70.91,8.91 v3(73.47,11.47) ; v3(81.71,37.68) 82.22,38.2 SW2.1
  Bottom Layer w0.25: v3(55.71,7.49) 56.1,7.1 56.1,5.95 58.38,3.66 59.54,3.66 59.91,4.03 59.91,6.35 60.05,6.49 60.44,6.49 61.37,7.42 63.84,7.42 65.34,8.91 v3(66.73,8.91) ; 84.03,27.13 73.47,16.56 v3(73.47,11.47) ; 84.03,27.13 81.71,29.45 v3(81.71,37.68) ; 84.03,27.13 85.25,25.91 85.25,23.37 J5.4
B2_D12: length 70.3
  Top Layer w0.25: v3(65.2,9.79) 64.71,9.79 62.82,11.68 59.6,11.68 v3(58.9,10.97) ; U2.16 55.42,8.88 56.07,9.53 56.07,9.57 v3(56.24,9.75) ; SW3.1 82.22,43.33 87.48,38.08 88.62,38.08 v3(88.93,37.78)
  Bottom Layer w0.25: 83.98,17.82 87.02,17.82 88.92,19.72 88.92,37.77 v3(88.93,37.78) ; 83.98,17.82 83.98,17.2 76.57,9.79 v3(65.2,9.79) ; 83.98,17.82 J5.1 ; v3(56.24,9.75) 58.25,9.75 58.9,10.4 v3(58.9,10.97)
BT_RXD: length 4.9
  Bottom Layer w0.25: J4.2 78.96,43.03 R21.1 R20.2
BT_TXD: length 5.5
  Top Layer w0.25: v3(77.42,44.72) 77.42,43.04 J4.3
  Bottom Layer w0.25: v3(77.42,44.72) R22.2
C0_A4: length 63.2
  Top Layer w0.25: v3(50.16,14.11) 49.57,13.52 48.17,13.52 47.75,13.95 ; v3(53.68,15.09) 60.29,21.7 60.29,55.89 58.76,57.41 50.4,57.41 J2.4
  Bottom Layer w0.25: v3(50.16,14.11) 51.14,15.09 v3(53.68,15.09)
CPH_A: length 5.5
  Top Layer w0.25: 31.23,13.75 31.23,14.07 31.05,14.25 30.31,14.25 28.48,16.08 28.48,17.68
CPH_B: length 7.4
  Top Layer w0.3: U4.13 72.68,24.54 71.77,25.46 68.21,25.46 68.03,25.63 68.03,26.71 C15.1
CPL_A: length 6
  Top Layer w0.25: C12.2 32.45,14.25 31.26,15.44 30.07,15.44 29.13,16.38 U3.14
CPL_B: length 14.1
  Top Layer w0.25: C15.2 69.51,26.75 69.56,26.8 69.56,27.79 69.05,28.3 67.53,28.3 66.64,27.41 66.64,26.11 70.65,22.11 71.59,22.11 72.03,22.54 U4.14
DIRA_D3: length 24.9
  Top Layer w0.25: v3(31.61,23.61) 31.61,24.09 30.89,24.81 30.39,24.81 29.78,24.2 U3.2 ; 44.93,8.89 44.93,9.96 v3(43.95,10.94)
  Bottom Layer w0.25: v3(31.61,23.61) 33.36,23.61 40.98,15.98 40.98,14.23 43.95,11.27 v3(43.95,10.94)
DIRB_D4: length 50.5
  Top Layer w0.25: U2.2 45.02,7.85 v3(43.86,7.85) ; 71.38,17.68 71.38,16.48 71.37,16.46 67.21,16.46 66.64,15.89 65.1,15.89 64.92,16.07 60.33,16.07 v3(59.62,16.77) ; 54.75,20.78 45.32,20.78 v3(43.89,19.34) ; v3(42.32,17.63) 40.47,17.63 38.92,16.08 v3(38.92,15.39)
  Bottom Layer w0.25: v3(59.62,16.77) 58.76,16.77 54.75,20.78 ; v3(43.89,19.34) 43.89,19.2 v3(42.32,17.63) ; v3(38.92,15.39) 38.92,14.29 41.46,11.75 41.46,9.5 43.11,7.85 v3(43.86,7.85)
  vias: v3(54.75,20.82)
DRV_SLEEP: length 50.4
  Top Layer w0.25: R13.2 29.14,25.74 ; 29.14,25.74 29.14,23.43 U3.3 ; 29.14,25.74 29.52,25.36 v3(30,25.36) ; U4.3 72.03,18.89 71.96,18.96 60.62,18.96 v3(60.62,18.96) ; 56.85,20.86 56.77,20.86 55.43,22.2 v3(40.99,22.2)
  Bottom Layer w0.25: v3(40.99,22.2) 37.82,25.36 v3(30,25.36) ; 56.85,20.86 58.75,18.96 v3(60.62,18.96)
  vias: v3(56.85,20.82)
DTR: length 23.2
  Top Layer w0.25: C18.1 60.86,9.76 59.17,9.76 v3(58.84,9.43) ; v3(47.37,10.39) 47.38,10.39 52.2,10.39 v3(52.88,9.71)
  Bottom Layer w0.25: v3(58.84,9.43) 58.84,8.56 58.21,7.93 56.57,7.93 56.39,8.11 55.69,8.11 54.09,9.71 v3(52.88,9.71) ; v3(47.37,10.39) 47.21,10.22 47.21,6.71 44.92,4.43
IPROPI_A: length 3.5
  Top Layer w0.25: U3.6 27.18,26.06 27.26,26.13 R14.1
IPROPI_B: length 3.3
  Top Layer w0.25: R15.1 73.49,15.17 73.98,15.66 73.98,17.68
IR_A5: length 50.7
  Top Layer w0.25: v3(20.98,15.97) 16.73,20.22 16.73,24.49 10.2,31.02 J6.1 ; 47.18,13.38 46.35,14.21 45.56,14.21 44.55,15.22 40.67,15.22 40,15.89
  Bottom Layer w0.25: v3(40,15.97) 39.94,16.02 21.04,16.02 v3(20.98,15.97)
LEDA_D2: length 64.5
  Top Layer w0.25: U2.32 44.66,11.12 44.21,11.57 39.24,11.57 38.15,10.49 32.18,10.49 27.39,5.69 19.39,5.69 15.96,9.12 15.96,24.11 6.57,33.51 R6.1
LEDB_D7: length 76.4
  Top Layer w0.25: v3(62.08,6.3) 61.91,6.3 60.52,4.91 53.39,4.91 52.25,6.05 ; R9.1 93,34.96 95.72,32.24 95.72,30.13 86.78,21.19 86.78,5.02 85.72,3.96 81.72,3.96 79.01,1.25 76.8,1.25 76.37,1.68 76.37,2.67 v3(72.73,6.3)
  Bottom Layer w0.25: v3(72.73,6.3) 72.68,6.36 62.14,6.36 v3(62.08,6.3)
LEDC_D13: length 76.6
  Top Layer w0.25: v3(66.3,25.25) 70.56,20.99 v3(70.56,20.59) ; v3(63.07,36.3) 63.07,37.69 68.67,43.29 ; v3(62.03,8.74) 61.91,8.61 v3(57.78,8.61) ; 55.07,11.11 55.44,10.73 v3(55.44,9.79) ; v3(85.25,21.33) 84.45,21.33 76.52,13.41 72.61,13.41 v3(72.53,13.33)
  Bottom Layer w0.25: v3(85.25,21.33) 84.48,22.1 J5.3 ; v3(62.03,8.74) 62.03,9.01 64.61,11.59 68.48,11.59 69.02,11.05 70.25,11.05 v3(72.53,13.33) 72.53,18.61 v3(70.56,20.59) ; v3(55.44,9.79) 55.44,9.06 55.88,8.61 v3(57.78,8.61) ; v3(66.3,25.25) 63.07,28.48 v3(63.07,36.3) 63.07,37.08
OUT_A1: length 18.4
  Top Layer w2.3: M1.2 17.87,35.29 22.89,30.27 22.89,24.68 23.99,23.58 24.98,23.58
OUT_A2: length 24
  Top Layer w0.4: U3.10 26.53,16.73 25.87,16.07
  Top Layer w1.3: 24.61,16.02 25.51,16.02
  Top Layer w2.3: 24.36,16.47 18.94,21.89 18.94,30.03 16.22,32.75 M1.1
OUT_B1: length 23.2
  Top Layer w2.3: 76.15,17.63 77.18,17.63 77.81,18.27 ; 77.94,18.47 88.35,28.89 88.35,31.98 87.59,32.75 M2.2
OUT_B2: length 19.6
  Top Layer w0.41: 75.99,24.75 74.89,24.75 74.64,24.49 74.64,23.43
  Top Layer w1.5: 77.21,24.97 76.03,24.97
  Top Layer w2.2: 77.24,25 80.23,25 82.38,27.16 82.38,34.02 83.4,35.03 ; M2.1 83.66,35.29
OUT_C: length 14.1
  Top Layer w1.5: 77.69,31.22 77.69,40.05 77.12,40.62 Q1.3 ; M3.2 77.18,30.46 77.69,30.97
  Bottom Layer w2.5: 77.61,28.89 D1.2
PWMA_D5: length 32.8
  Top Layer w0.25: U2.9 50.45,5.59 v3(50.45,8.11) ; 30.8,21.12 30.43,21.49 U3.1 ; v3(32.8,19.04) 41.85,19.04 46.08,14.82 46.46,14.82 v3(46.59,14.94)
  Bottom Layer w0.25: v3(32.8,19.04) 30.8,21.04 30.8,21.12 ; v3(46.59,14.94) 50.45,11.08 v3(50.45,8.11)
  vias: v3(30.8,21.06)
PWMB_D6: length 36.3
  Top Layer w0.25: v3(63.98,17.91) 59.85,17.91 57.65,15.7 57.65,14.99 ; U4.1 70.47,17.94 67.12,17.94 ; v3(59.02,4.29) 59.02,4.22 58.79,3.99 53.48,3.99 51.99,5.49 U2.10
  Bottom Layer w0.25: 67.12,17.94 66.88,18.19 66.88,18.67 66.62,18.92 64.37,18.92 64.1,18.65 64.1,18.03 v3(63.98,17.91) ; 57.65,14.99 57.65,13.2 59.72,11.13 59.72,8.81 59.02,8.11 v3(59.02,4.29)
  vias: v3(57.65,15.09) v3(67.12,17.91)
PWMC_D10: length 48.1
  Top Layer w0.25: U2.14 53.49,8.2 v3(51.78,8.2) ; v3(54.98,15.09) 54.98,15.17 62.44,22.63 62.44,34.79 67.59,39.94 67.59,41.19 68.41,42.02 69.44,42.02 69.96,42.53 69.96,44.18 70.46,44.68 R16.1
  Bottom Layer w0.25: v3(54.98,15.09) 54.98,14.48 51.4,10.9 51.4,8.59 v3(51.78,8.2)
RESET: length 76.1
  Top Layer w0.25: R10.2 36.84,13.7 45.74,13.7 46.62,12.82 47.55,11.89 52.08,11.89 v3(53.19,10.78) ; C18.2 61.18,10.56 ; 61.18,10.56 60.59,10.56 60.37,10.35 57.89,10.35 v3(57.83,10.4) ; 61.18,10.56 61.76,10.56 62.79,9.54 62.79,8.76 v3(62.83,8.72) ; 78.12,5.01 76.16,6.97 60.33,6.97 v3(60.19,7.11) ; 78.12,5.01 78.12,12.62 v3(82.24,16.74) ; 78.12,5.01 SW1.2
  Bottom Layer w0.25: v3(57.83,10.4) 57.45,10.78 v3(53.19,10.78) ; v3(62.83,8.72) 62.83,8.65 62.28,8.11 60.79,8.11 60.19,7.5 v3(60.19,7.11) ; v3(82.24,16.74) 82.2,16.78 82.2,22.86 J5.5
RX_D0: length 68
  Top Layer w0.25: v3(75.92,46.67) 74.99,47.59 68.38,47.59 60.93,40.14 v3(60.93,29.5) ; v3(48.13,11.03) 47.27,11.03 46.05,12.25
  Bottom Layer w0.25: 50,4.43 50,5.89 49.62,6.27 49.62,9.54 v3(48.13,11.03) 48.1,11.03 44.86,14.28 44.86,15.82 46.73,17.69 49.3,17.69 60.93,29.33 v3(60.93,29.5) ; R22.1 v3(75.92,46.67)
S0_A0: length 44.9
  Top Layer w0.25: J2.8 58.89,42.78 59.69,41.98 59.69,22.62 51.68,14.61 U2.23
S1_A1: length 45.1
  Top Layer w0.25: J2.7 56.35,43.03 59.03,40.36 v3(59.03,36.3) ; v3(59.03,29.45) 59.03,26.39 v3(55.69,23.05) ; 51.11,15.07 53.58,17.54 v3(53.58,17.93)
  Bottom Layer w0.25: v3(59.03,36.3) v3(59.03,29.45) ; v3(53.58,17.93) 53.58,20.83 55.69,22.94 v3(55.69,23.05)
S2_A2: length 50.8
  Top Layer w0.25: U2.25 48.33,15.63 48.03,15.63 v3(45.83,17.83) ; J2.6 39.33,41.26 39.33,29.43 v3(45.83,22.93)
  Bottom Layer w0.25: v3(45.83,22.93) v3(45.83,17.83)
S3_A3: length 51.7
  Top Layer w0.25: U2.26 46.21,16.62 45.57,16.62 37.55,24.64 37.55,42.02 J2.5
TX_D1: length 76.1
  Top Layer w0.25: v3(66.9,44.43) 61.56,39.09 61.56,23.46 v3(61.14,23.05) ; v3(43.09,13.02) 43.09,12.39 43.01,12.32 ; v3(55.86,20.82) 55.68,20.82 53.46,18.6 44.54,18.6 ; v3(73.42,42.24) 73.42,44.63 72.35,45.7 70.32,45.7 70.07,45.45 70.07,45.45 v3(69.94,45.32) ; 43.01,12.32 44.85,12.32 U2.31 46.71,10.46 46.71,10.12 47.45,9.38 48.72,9.38 v3(48.82,9.27) ; 43.01,12.32 42.67,12.32 42.65,12.3 41.91,12.3
  Bottom Layer w0.25: R20.1 75.17,40.37 73.42,42.12 v3(73.42,42.24) ; v3(66.9,44.43) 67.79,45.32 v3(69.94,45.32) ; v3(43.09,13.02) 43.09,17.15 v3(44.54,18.6) ; 61.14,23.03 58.06,23.03 v3(55.86,20.82) ; v3(48.82,9.27) 48.82,7.25 47.46,5.89 47.46,4.43
VCP_A: length 3.5
  Top Layer w0.25: 28.11,14.25 28.11,15.04 27.83,15.33 U3.12
VCP_B: length 3.9
  Top Layer w0.25: 71.86,26.75 71.86,26.12 73.33,24.66 U4.12
VREF: length 61.2
  Top Layer w0.25: R12.1 70.86,12.16 ; 70.86,12.16 R11.2 ; 70.86,12.16 70.86,14.24 ; 70.86,14.24 v3(67.07,14.24) ; 70.86,14.24 70.86,15.45 71.41,16 72.6,16 73.33,16.73 U4.5 ; v3(32.83,21.06) 40.47,21.06 45.55,15.98 v3(45.93,15.98) ; v3(28.49,25.4) 28.18,25.4 27.83,25.05 U3.5
  Bottom Layer w0.25: v3(32.83,21.06) 32.83,21.18 28.61,25.4 v3(28.49,25.4) ; v3(67.07,14.24) 65.33,15.98 v3(45.93,15.98)
XTAL1: length 18.4
  Top Layer w0.25: U2.7 49.29,6.46 49.62,6.46 49.94,6.14 49.94,4.11 49.62,3.79 41.35,3.79 X1.1 39.69,8.54 C9.1
XTAL2: length 9.3
  Top Layer w0.25: 48.89,4.93 48.38,4.43 45.56,4.43 44.54,5.44 X1.2 42.63,6.6 C10.1
$1N2286: length 5.1
  Top Layer w0.25: R1.2 28.79,47.86 26.6,47.86 LED1.2
$1N2289: length 1.9
  Top Layer w0.25: R6.2 4.75,38.25 LED2.2
$1N2298: length 2
  Top Layer w0.25: R9.2 94.9,38.25 LED3.2
$1N2345: length 2.2
  Top Layer w0.25: LED4.2 68.67,46.5 68.67,44.8
$1N2346: length 3.7
  Top Layer w0.3: R19.2 37.29,12.3 40.31,12.3 LED5.2
$1N2435: length 6.7
  Top Layer w0.25: 71.5,41.57 70.64,40.71 R17.1 ; 71.5,41.57 Q1.1 ; 71.5,41.57 71.5,42.87 71.08,43.3

## Copper pours and planes (outline as drawn; the poured copper is in the pictures)
GND on Top Layer: -44.62,66.66 143.98,66.66 143.98,-10.43 -44.62,-10.43
GND on Bottom Layer: -40.17,61.07 139.03,61.07 139.03,-3.96 -40.17,-3.96

## Text on the board
Bottom Silkscreen Layer: RST | SCK | MISO | GND | MOSI | 5V | - | + | Projetado por Erick Matos
Top Silkscreen Layer: + | -
